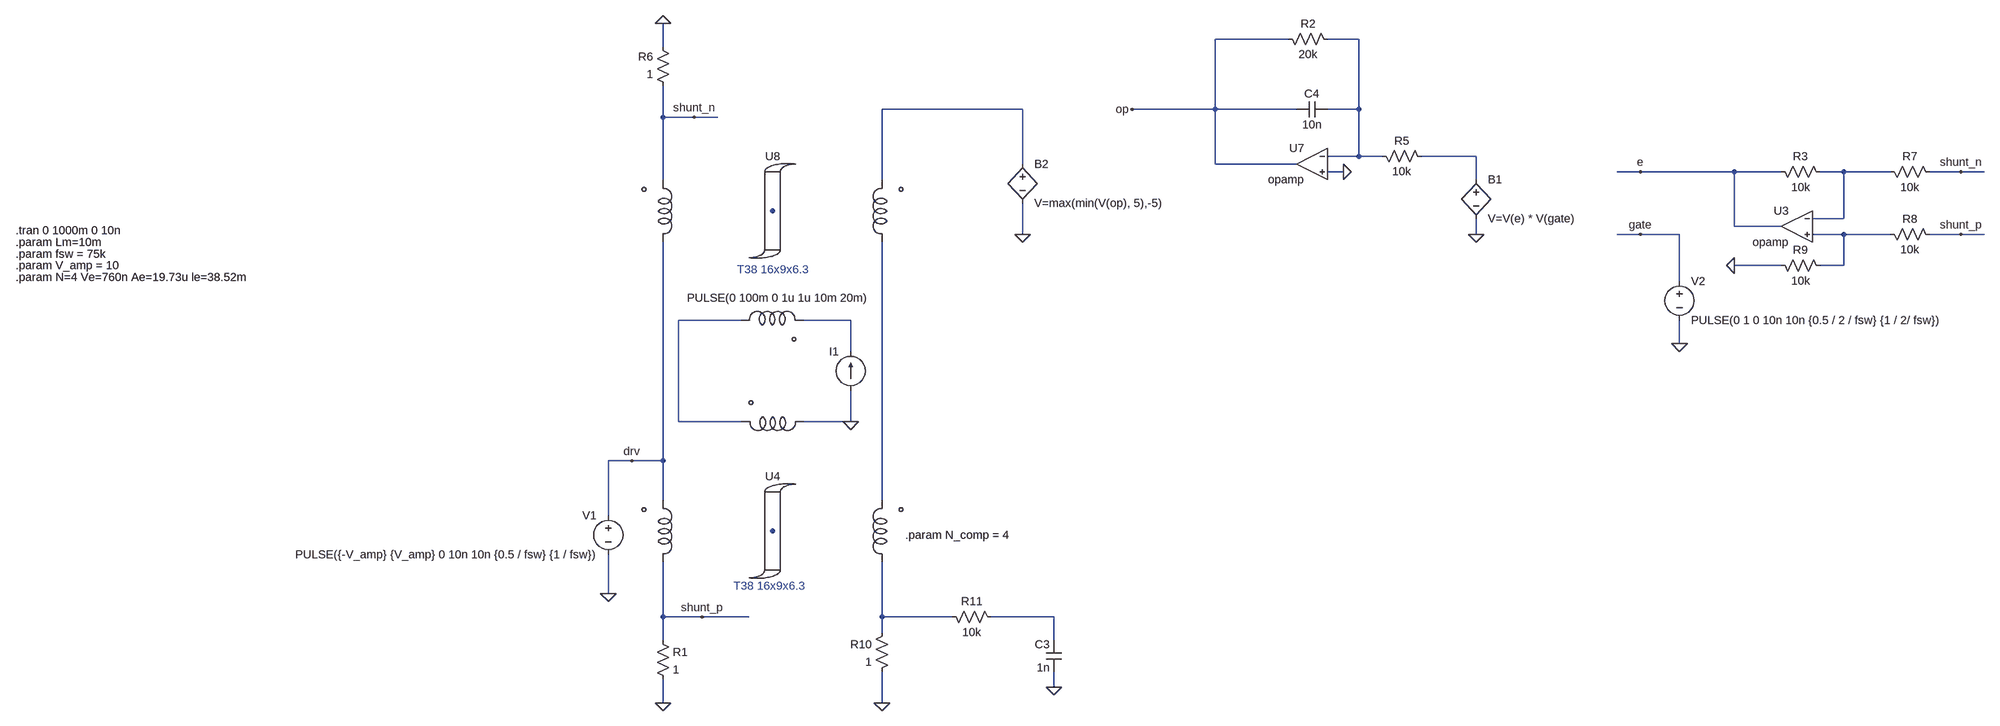
[diagram p0: schematic T38_16x9x6.3.asc]
T38_16x9x6.3.asc, the LTspice schematic file:
Version 4
SHEET 1 3936 1332
WIRE 896 -2816 704 -2816
WIRE 1040 -2816 976 -2816
WIRE -816 -2800 -816 -2848
WIRE -80 -2672 -368 -2672
WIRE 704 -2672 704 -2816
WIRE 704 -2672 144 -2672
WIRE 912 -2672 704 -2672
WIRE 1040 -2672 1040 -2816
WIRE 1040 -2672 976 -2672
WIRE -816 -2656 -816 -2720
WIRE -752 -2656 -816 -2656
WIRE -704 -2656 -752 -2656
WIRE 1040 -2576 1040 -2672
WIRE 1040 -2576 976 -2576
WIRE 1088 -2576 1040 -2576
WIRE 1280 -2576 1168 -2576
WIRE -80 -2560 -80 -2672
WIRE 704 -2560 704 -2672
WIRE 912 -2560 704 -2560
WIRE 1008 -2544 976 -2544
WIRE 1616 -2544 1568 -2544
WIRE 1808 -2544 1616 -2544
WIRE 1904 -2544 1808 -2544
WIRE 2032 -2544 1984 -2544
WIRE 2128 -2544 2032 -2544
WIRE 2272 -2544 2208 -2544
WIRE 2320 -2544 2272 -2544
WIRE -816 -2528 -816 -2656
WIRE -368 -2528 -368 -2672
WIRE 1280 -2528 1280 -2576
WIRE 2032 -2448 2032 -2544
WIRE 2032 -2448 1968 -2448
WIRE 1808 -2432 1808 -2544
WIRE 1904 -2432 1808 -2432
WIRE -80 -2416 -80 -2480
WIRE 1280 -2416 1280 -2448
WIRE 1616 -2416 1568 -2416
WIRE 1696 -2416 1616 -2416
WIRE 2032 -2416 1968 -2416
WIRE 2128 -2416 2032 -2416
WIRE 2272 -2416 2208 -2416
WIRE 2320 -2416 2272 -2416
WIRE 1904 -2352 1808 -2352
WIRE 2032 -2352 2032 -2416
WIRE 2032 -2352 1984 -2352
WIRE 1696 -2320 1696 -2416
WIRE -656 -2240 -784 -2240
WIRE -432 -2240 -528 -2240
WIRE 1696 -2192 1696 -2240
WIRE -432 -2176 -432 -2240
WIRE -784 -2032 -784 -2240
WIRE -656 -2032 -784 -2032
WIRE -432 -2032 -432 -2096
WIRE -432 -2032 -528 -2032
WIRE -880 -1952 -928 -1952
WIRE -816 -1952 -816 -2400
WIRE -816 -1952 -880 -1952
WIRE -816 -1872 -816 -1952
WIRE -368 -1872 -368 -2400
WIRE -928 -1840 -928 -1952
WIRE -928 -1680 -928 -1760
WIRE -816 -1632 -816 -1744
WIRE -736 -1632 -816 -1632
WIRE -640 -1632 -736 -1632
WIRE -368 -1632 -368 -1744
WIRE -224 -1632 -368 -1632
WIRE -16 -1632 -144 -1632
WIRE -368 -1600 -368 -1632
WIRE -816 -1584 -816 -1632
WIRE -16 -1584 -16 -1632
WIRE -16 -1488 -16 -1520
WIRE -816 -1456 -816 -1504
WIRE -368 -1456 -368 -1520
FLAG -928 -1680 0
FLAG 1696 -2192 0
FLAG -880 -1952 drv
FLAG -816 -2848 0
FLAG 1808 -2352 0
FLAG -736 -1632 shunt_p
FLAG 2272 -2416 shunt_p
FLAG 2272 -2544 shunt_n
FLAG -752 -2656 shunt_n
FLAG -368 -1456 0
FLAG -816 -1456 0
FLAG 1616 -2416 gate
FLAG 1616 -2544 e
FLAG 1280 -2416 0
FLAG -432 -2032 0
FLAG 1008 -2544 0
FLAG 144 -2672 op
FLAG -80 -2416 0
FLAG -16 -1488 0
SYMBOL voltage -928 -1856 M0
WINDOW 123 0 0 Left 0
WINDOW 39 0 0 Left 0
SYMATTR InstName V1
SYMATTR Value PULSE({-V_amp} {V_amp} 0 10n 10n {0.5 / fsw} {1 / fsw})
SYMBOL Winding -816 -1808 R0
WINDOW 0 -93 39 Invisible 2
WINDOW 39 -225 76 Invisible 2
WINDOW 3 -98 42 Invisible 2
SYMATTR InstName U1
SYMATTR SpiceLine n={N} L=10n Rs=1m Rp=100Meg
SYMBOL Core_Chan -592 -1808 R0
WINDOW 3 41 88 Invisible 2
WINDOW 39 13 112 Invisible 2
WINDOW 0 1 -96 Bottom 2
SYMATTR SpiceLine Bs=0.43 Br=0.1 Hc=8
SYMATTR InstName U4
SYMATTR SpiceLine2 A={Ae} Lm={le} Lg=0 Rp=1Meg
SYMBOL res -832 -1600 R0
SYMATTR InstName R1
SYMATTR Value 1
SYMBOL Winding -592 -2032 M90
WINDOW 0 -93 39 Invisible 2
WINDOW 39 -196 73 Invisible 2
WINDOW 3 -98 42 Invisible 2
SYMATTR InstName U2
SYMATTR SpiceLine n={1} L=10n Rs=1m Rp=100k
SYMBOL current -432 -2096 R180
WINDOW 0 24 80 Left 2
WINDOW 3 149 190 Center 2
WINDOW 123 0 0 Left 0
WINDOW 39 0 0 Left 0
SYMATTR InstName I1
SYMATTR Value PULSE(0 100m 0 1u 1u 10m 20m)
SYMBOL voltage 1696 -2336 R0
WINDOW 123 0 0 Left 0
WINDOW 39 0 0 Left 0
SYMATTR InstName V2
SYMATTR Value PULSE(0 1 0 10n 10n {0.5 / 2 / fsw} {1 / 2/ fsw})
SYMBOL opamp 944 -2624 M0
SYMATTR InstName U7
SYMBOL Winding -816 -2464 R0
WINDOW 0 221 26 Invisible 2
WINDOW 39 259 -62 Invisible 2
WINDOW 3 214 -32 Invisible 2
SYMATTR InstName U6
SYMATTR SpiceLine n={N} L=10n Rs=1m Rp=100Meg
SYMBOL Core_Chan -592 -2464 R0
WINDOW 3 41 88 Invisible 2
WINDOW 39 13 112 Invisible 2
WINDOW 0 1 -96 Bottom 2
SYMATTR SpiceLine Bs=0.43 Br=0.1 Hc=8
SYMATTR InstName U8
SYMATTR SpiceLine2 A={Ae} Lm={le} Lg=0 Rp=1Meg
SYMBOL res -800 -2704 R180
WINDOW 0 36 76 Left 2
WINDOW 3 36 40 Left 2
SYMATTR InstName R6
SYMATTR Value 1
SYMBOL Winding -592 -2240 M270
WINDOW 0 -93 39 Invisible 2
WINDOW 39 -196 73 Invisible 2
WINDOW 3 -98 42 Invisible 2
SYMATTR InstName U9
SYMATTR SpiceLine n={1} L=10n Rs=1m Rp=100k
SYMBOL opamp 1936 -2496 M0
SYMATTR InstName U3
SYMBOL res 1888 -2560 M90
WINDOW 0 0 56 VBottom 2
WINDOW 3 32 56 VTop 2
SYMATTR InstName R3
SYMATTR Value 10k
SYMBOL res 2112 -2560 M90
WINDOW 0 0 56 VBottom 2
WINDOW 3 32 56 VTop 2
SYMATTR InstName R7
SYMATTR Value 10k
SYMBOL res 2112 -2432 M90
WINDOW 0 0 56 VBottom 2
WINDOW 3 32 56 VTop 2
SYMATTR InstName R8
SYMATTR Value 10k
SYMBOL res 1888 -2368 M90
WINDOW 0 0 56 VBottom 2
WINDOW 3 32 56 VTop 2
SYMATTR InstName R9
SYMATTR Value 10k
SYMBOL Winding -368 -1808 M0
WINDOW 0 -93 39 Invisible 2
WINDOW 39 -225 76 Invisible 2
WINDOW 3 -98 42 Invisible 2
SYMATTR InstName U10
SYMATTR SpiceLine n={N_comp} L=10n Rs=1m Rp=100Meg
SYMBOL Winding -368 -2464 M0
WINDOW 0 221 26 Invisible 2
WINDOW 39 259 -62 Invisible 2
WINDOW 3 214 -32 Invisible 2
SYMATTR InstName U11
SYMATTR SpiceLine n={N_comp} L=10n Rs=1m Rp=100Meg
SYMBOL res -352 -1616 M0
SYMATTR InstName R10
SYMATTR Value 1
SYMBOL bv 1280 -2544 R0
SYMATTR InstName B1
SYMATTR Value V=V(e) * V(gate)
SYMBOL res 1072 -2592 M90
WINDOW 0 0 56 VBottom 2
WINDOW 3 32 56 VTop 2
SYMATTR InstName R5
SYMATTR Value 10k
SYMBOL bv -80 -2576 R0
SYMATTR InstName B2
SYMATTR Value V=max(min(V(op), 5),-5)
SYMBOL cap 976 -2688 R90
WINDOW 0 0 32 VBottom 2
WINDOW 3 32 32 VTop 2
SYMATTR InstName C4
SYMATTR Value 10n
SYMBOL cap 0 -1584 M0
SYMATTR InstName C3
SYMATTR Value 1n
SYMBOL res -240 -1648 M90
WINDOW 0 0 56 VBottom 2
WINDOW 3 32 56 VTop 2
SYMATTR InstName R11
SYMATTR Value 10k
SYMBOL res 880 -2832 M90
WINDOW 0 0 56 VBottom 2
WINDOW 3 32 56 VTop 2
SYMATTR InstName R2
SYMATTR Value 20k
TEXT -2856 -2424 Left 2 !.tran 0 1000m 0 10n
TEXT -2856 -2328 Left 2 !.param N=4 Ve=760n Ae=19.73u le=38.52m
TEXT -2856 -2400 Left 2 !.param Lm=10m
TEXT -2856 -2376 Left 2 !.param fsw = 75k
TEXT -2856 -2352 Left 2 !.param V_amp = 10
TEXT -672 -1696 Left 2 ;T38 16x9x6.3
TEXT -320 -1800 Left 2 !.param N_comp = 4
TEXT -664 -2344 Left 2 ;T38 16x9x6.3

The netlist it stands for:
* T38_16x9x6.3.asc
V1 drv 0 PULSE({-V_amp} {V_amp} 0 10n 10n {0.5 / fsw} {1 / fsw})
XU1 shunt_p drv P001 Winding n={N} L=10n Rs=1m Rp=100Meg  ; pins s f c
XU4 P001 Core_Chan Bs=0.43 Br=0.1 Hc=8 A={Ae} Lm={le} Lg=0 Rp=1Meg  ; pins C
R1 shunt_p 0 1
XU2 0 N006 P001 Winding n={1} L=10n Rs=1m Rp=100k  ; pins s f c
I1 0 N007 PULSE(0 100m 0 1u 1u 10m 20m)
V2 gate 0 PULSE(0 1 0 10n 10n {0.5 / 2 / fsw} {1 / 2/ fsw})
XU7 N001 0 op opamp Aol=100K GBW=10Meg  ; pins invin noninvin out
XU6 drv shunt_n P002 Winding n={N} L=10n Rs=1m Rp=100Meg  ; pins s f c
XU8 P002 Core_Chan Bs=0.43 Br=0.1 Hc=8 A={Ae} Lm={le} Lg=0 Rp=1Meg  ; pins C
R6 shunt_n 0 1
XU9 N006 N007 P002 Winding n={1} L=10n Rs=1m Rp=100k  ; pins s f c
XU3 N004 N005 e opamp Aol=100K GBW=10Meg  ; pins invin noninvin out
R3 e N004 10k
R7 N004 shunt_n 10k
R8 N005 shunt_p 10k
R9 0 N005 10k
XU10 N009 N008 P001 Winding n={N_comp} L=10n Rs=1m Rp=100Meg  ; pins s f c
XU11 N008 N002 P002 Winding n={N_comp} L=10n Rs=1m Rp=100Meg  ; pins s f c
R10 N009 0 1
B1 N003 0 V=V(e) * V(gate)
R5 N001 N003 10k
B2 N002 0 V=max(min(V(op), 5),-5)
C4 N001 op 10n
C3 N010 0 1n
R11 N009 N010 10k
R2 op N001 20k
.tran 0 1000m 0 10n
.param N=4 Ve=760n Ae=19.73u le=38.52m
.param Lm=10m
.param fsw = 75k
.param V_amp = 10
* T38 16x9x6.3
.param N_comp = 4
* T38 16x9x6.3
.lib Winding.lib
.lib Core_Chan.lib
.backanno
.end